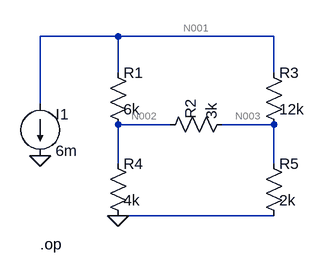
[diagram p0: schematic Ex03.asc]
Ex03.asc, the LTspice schematic file:
Version 4
SHEET 1 880 680
WIRE 60 184 60 80
WIRE 60 80 180 80
WIRE 180 80 180 136
WIRE 180 80 420 80
WIRE 420 80 420 136
WIRE 180 216 180 276
WIRE 420 216 420 276
WIRE 180 216 260 216
WIRE 340 216 420 216
WIRE 180 356 420 356
FLAG 60 264 0
FLAG 180 356 0
SYMBOL current 60 184 R0
WINDOW 0 24 16 Left 2
WINDOW 3 24 72 Left 2
SYMATTR InstName I1
SYMATTR Value 6m
SYMBOL res 164 120 R0
WINDOW 0 24 16 Left 2
WINDOW 3 24 72 Left 2
SYMATTR InstName R1
SYMATTR Value 6k
SYMBOL res 404 120 R0
WINDOW 0 24 16 Left 2
WINDOW 3 24 72 Left 2
SYMATTR InstName R3
SYMATTR Value 12k
SYMBOL res 244 232 R270
WINDOW 0 24 48 Left 2
WINDOW 3 24 80 Left 2
SYMATTR InstName R2
SYMATTR Value 3k
SYMBOL res 164 260 R0
WINDOW 0 24 16 Left 2
WINDOW 3 24 72 Left 2
SYMATTR InstName R4
SYMATTR Value 4k
SYMBOL res 404 260 R0
WINDOW 0 24 16 Left 2
WINDOW 3 24 72 Left 2
SYMATTR InstName R5
SYMATTR Value 2k
TEXT 60 400 Left 2 !.op

The netlist it stands for:
* Ex03.asc
I1 N001 0 6m
R1 N001 N002 6k
R3 N001 N003 12k
R2 N002 N003 3k
R4 N002 0 4k
R5 N003 0 2k
.op
.backanno
.end

* Results of the author's LTspice run, read from the files saved beside the schematic
* Operating Point:
*   V(n001) = -33.2 V
*   V(n002) = -10.4 V
*   V(n003) = -6.8 V
*   I(I1) = 6 mA
*   I(R1) = -3.8 mA
*   I(R2) = -1.2 mA
*   I(R3) = -2.2 mA
*   I(R4) = -2.6 mA
*   I(R5) = -3.4 mA